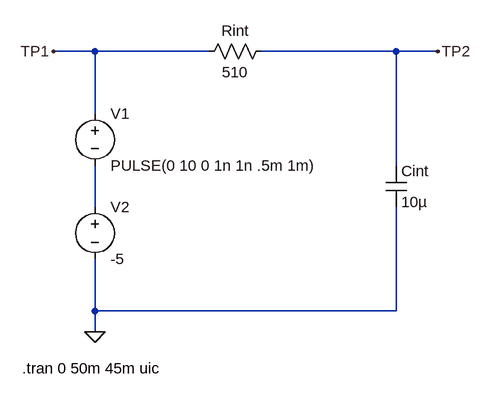
[diagram p0: schematic 3.2.asc]
3.2.asc, the LTspice schematic file:
Version 4.1
SHEET 1 880 680
WIRE 0 -32 -64 -32
WIRE 176 -32 0 -32
WIRE 464 -32 256 -32
WIRE 528 -32 464 -32
WIRE 0 64 0 -32
WIRE 464 144 464 -32
WIRE 0 208 0 144
WIRE 0 368 0 288
WIRE 464 368 464 208
WIRE 464 368 0 368
WIRE 0 400 0 368
FLAG 0 400 0
FLAG -64 -32 TP1
FLAG 528 -32 TP2
SYMBOL voltage 0 48 R0
WINDOW 123 0 0 Left 0
WINDOW 39 0 0 Left 0
SYMATTR InstName V1
SYMATTR Value PULSE(0 10 0 1n 1n .5m 1m)
SYMBOL res 272 -48 R90
WINDOW 0 0 56 VBottom 2
WINDOW 3 32 56 VTop 2
SYMATTR InstName Rint
SYMATTR Value 510
SYMBOL cap 448 144 R0
SYMATTR InstName Cint
SYMATTR Value 10µ
SYMBOL voltage 0 192 R0
WINDOW 123 0 0 Left 0
WINDOW 39 0 0 Left 0
SYMATTR InstName V2
SYMATTR Value -5
TEXT -112 456 Left 2 !.tran 0 50m 45m uic

The netlist it stands for:
* 3.2.asc
V1 TP1 N001 PULSE(0 10 0 1n 1n .5m 1m)
Rint TP2 TP1 510
Cint TP2 0 10µ
V2 N001 0 -5
.tran 0 50m 45m uic
.backanno
.end

* Results of the author's LTspice run, read from the files saved beside the schematic
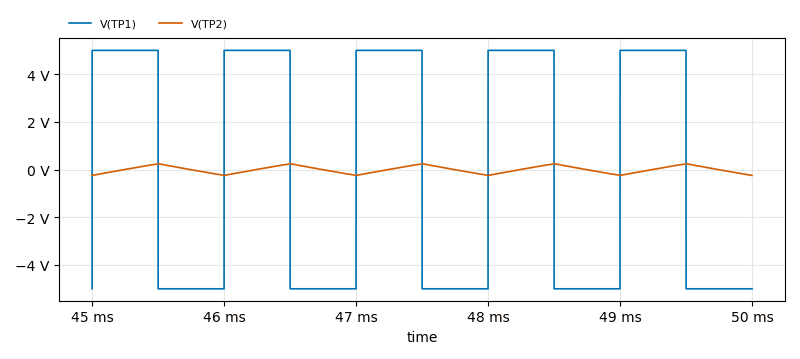
[diagram p1: Transient Analysis of 3.2.asc, plotted from the saved traces]
* Transient Analysis, 1 run:
*   V(TP1): min -5 V, max 5 V, average 10 µV, rms 5 V, last -5 V
*   V(TP2): min -244.9 mV, max 244.9 mV, average 32.74 µV, rms 141.7 mV, last -244.9 mV